# Altium schematic sheet HVD.SchDoc: PDM
size A3; CompanyName: eUSRacing; DrawnBy: Javier González; SheetNumber: 4; SheetTotal: 8
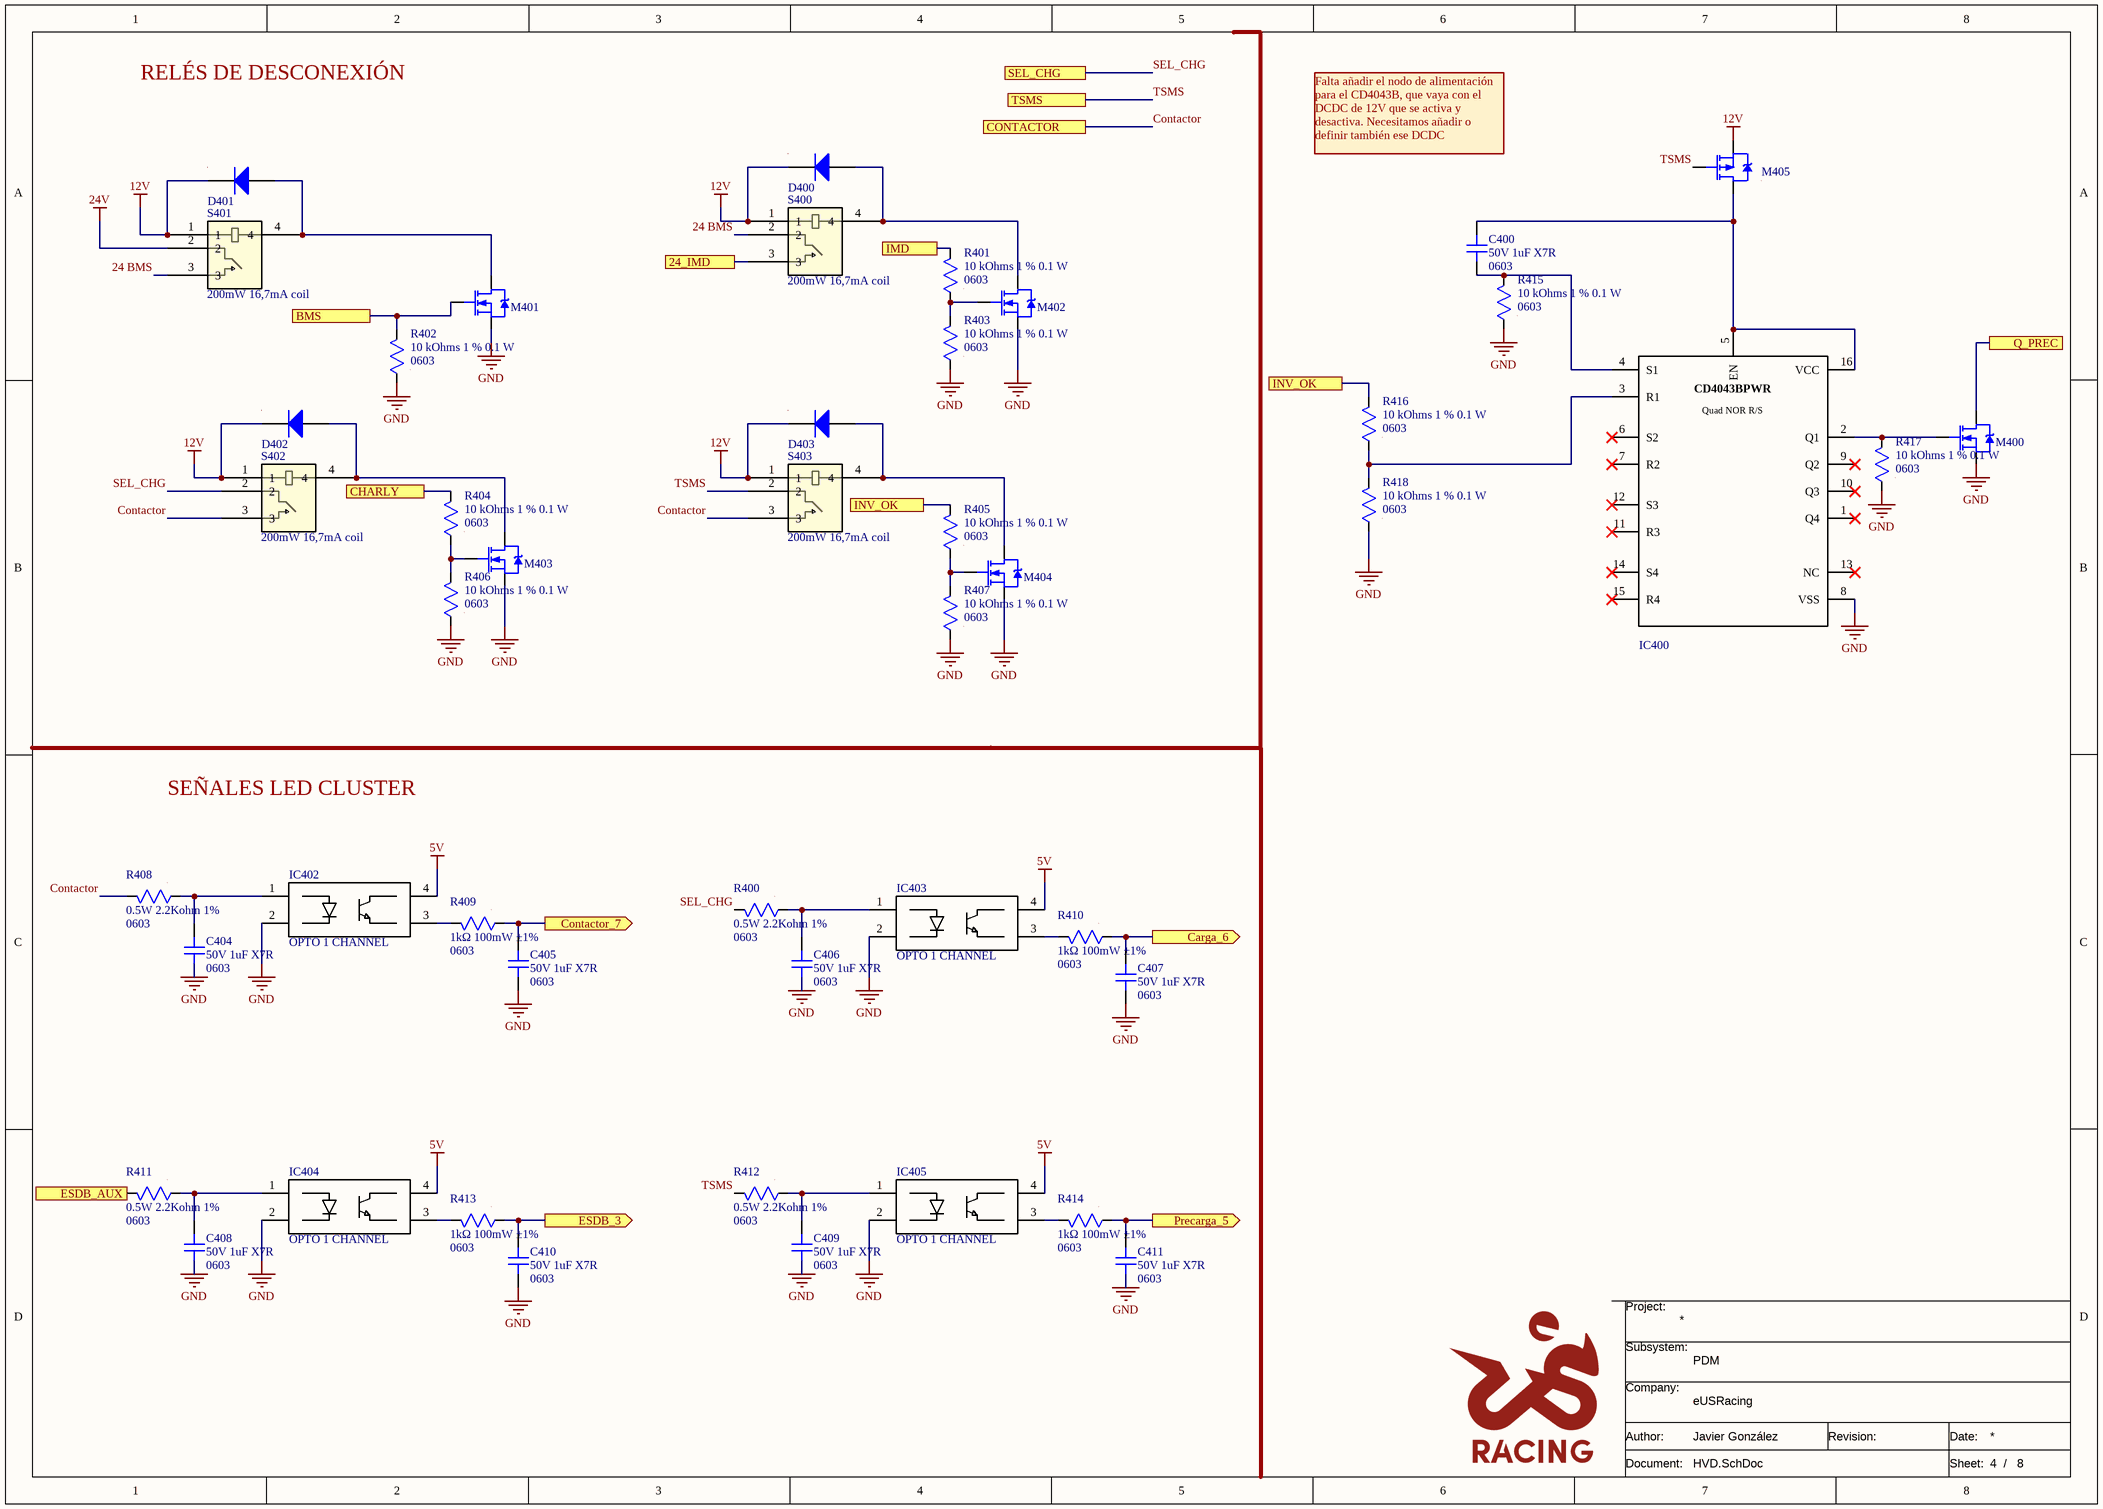
[diagram p0: HVD.SchDoc]

## Parts
C400  value 50V 1uF X7R  Package: 0603  [CAP SMD 0603]  (hidden comment: CAP non polarized)
C404  value 50V 1uF X7R  Package: 0603  [CAP SMD 0603]  (hidden comment: CAP non polarized)
C405  value 50V 1uF X7R  Package: 0603  [CAP SMD 0603]  (hidden comment: CAP non polarized)
C406  value 50V 1uF X7R  Package: 0603  [CAP SMD 0603]  (hidden comment: CAP non polarized)
C407  value 50V 1uF X7R  Package: 0603  [CAP SMD 0603]  (hidden comment: CAP non polarized)
C408  value 50V 1uF X7R  Package: 0603  [CAP SMD 0603]  (hidden comment: CAP non polarized)
C409  value 50V 1uF X7R  Package: 0603  [CAP SMD 0603]  (hidden comment: CAP non polarized)
C410  value 50V 1uF X7R  Package: 0603  [CAP SMD 0603]  (hidden comment: CAP non polarized)
C411  value 50V 1uF X7R  Package: 0603  [CAP SMD 0603]  (hidden comment: CAP non polarized)
D400  DIODE  [DO-214AC]  (value not drawn)
D401  DIODE  [DO-214AC]  (value not drawn)
D402  DIODE  [DO-214AC]  (value not drawn)
D403  DIODE  [DO-214AC]  (value not drawn)
IC400  CD4043BPWR  [TSOP16]  (value not drawn)
IC402  OPTO 1 CHANNEL  [DIP-4]
IC403  OPTO 1 CHANNEL  [DIP-4]
IC404  OPTO 1 CHANNEL  [DIP-4]
IC405  OPTO 1 CHANNEL  [DIP-4]
M400  MOSFET N  [SOT-323]  (value not drawn)
M401  MOSFET N  [SOT-323]  (value not drawn)
M402  MOSFET N  [SOT-323]  (value not drawn)
M403  MOSFET N  [SOT-323]  (value not drawn)
M404  MOSFET N  [SOT-323]  (value not drawn)
M405  MOSFET P  [SOT-23]  (value not drawn)
R400  value 0.5W 2.2Kohm 1%  Package: 0603  [RES SMD 0603]  (hidden comment: RES)
R401  value 10 kOhms 1 % 0.1 W  Package: 0603  [RES SMD 0603]  (hidden comment: RES)
R402  value 10 kOhms 1 % 0.1 W  Package: 0603  [RES SMD 0603]  (hidden comment: RES)
R403  value 10 kOhms 1 % 0.1 W  Package: 0603  [RES SMD 0603]  (hidden comment: RES)
R404  value 10 kOhms 1 % 0.1 W  Package: 0603  [RES SMD 0603]  (hidden comment: RES)
R405  value 10 kOhms 1 % 0.1 W  Package: 0603  [RES SMD 0603]  (hidden comment: RES)
R406  value 10 kOhms 1 % 0.1 W  Package: 0603  [RES SMD 0603]  (hidden comment: RES)
R407  value 10 kOhms 1 % 0.1 W  Package: 0603  [RES SMD 0603]  (hidden comment: RES)
R408  value 0.5W 2.2Kohm 1%  Package: 0603  [RES SMD 0603]  (hidden comment: RES)
R409  value 1kΩ 100mW ±1%  Package: 0603  [RES SMD 0603]  (hidden comment: RES)
R410  value 1kΩ 100mW ±1%  Package: 0603  [RES SMD 0603]  (hidden comment: RES)
R411  value 0.5W 2.2Kohm 1%  Package: 0603  [RES SMD 0603]  (hidden comment: RES)
R412  value 0.5W 2.2Kohm 1%  Package: 0603  [RES SMD 0603]  (hidden comment: RES)
R413  value 1kΩ 100mW ±1%  Package: 0603  [RES SMD 0603]  (hidden comment: RES)
R414  value 1kΩ 100mW ±1%  Package: 0603  [RES SMD 0603]  (hidden comment: RES)
R415  value 10 kOhms 1 % 0.1 W  Package: 0603  [RES SMD 0603]  (hidden comment: RES)
R416  value 10 kOhms 1 % 0.1 W  Package: 0603  [RES SMD 0603]  (hidden comment: RES)
R417  value 10 kOhms 1 % 0.1 W  Package: 0603  [RES SMD 0603]  (hidden comment: RES)
R418  value 10 kOhms 1 % 0.1 W  Package: 0603  [RES SMD 0603]  (hidden comment: RES)
S400  value 200mW 16,7mA coil  [G5NB-1A]  (hidden comment: RELE G5NB-1A)
S401  value 200mW 16,7mA coil  [G5NB-1A]  (hidden comment: RELE G5NB-1A)
S402  value 200mW 16,7mA coil  [G5NB-1A]  (hidden comment: RELE G5NB-1A)
S403  value 200mW 16,7mA coil  [G5NB-1A]  (hidden comment: RELE G5NB-1A)

## Ports
24_IMD, BMS, Carga_6 (out), CHARLY, CONTACTOR, Contactor_7 (out), ESDB_3 (out), ESDB_AUX, IMD, INV_OK, Precarga_5 (out), Q_PREC, SEL_CHG, TSMS

## Nets
5V: IC402.4(C_1) IC403.4(C_1) IC404.4(C_1) IC405.4(C_1)
12V: D400.K D401.K D402.K D403.K M405.2(S) S400.1 S401.1 S402.1 S403.1
24V: S401.2
GND: C404.2 C405.2 C406.2 C407.2 C408.2 C409.2 C410.2 C411.2 IC400.8(VSS) IC402.2(K_1) IC403.2(K_1) IC404.2(K_1) IC405.2(K_1) M400.2(S) M401.2(S) M402.2(S) M403.2(S) M404.2(S) R402.1 R403.1 R406.1 R407.1 R415.1 R417.1 R418.1
24 BMS: S400.2 S401.3
24_IMD: S400.3 ; port 24_IMD
BMS: M401.1(G) R402.2 ; port BMS
Carga_6: C407.1 R410.1 ; port Carga_6
CHARLY: R404.2 ; port CHARLY
Contactor: R408.2 S402.3 S403.3 ; port CONTACTOR
Contactor_7: C405.1 R409.1 ; port Contactor_7
ESDB_3: C410.1 R413.1 ; port ESDB_3
ESDB_AUX: R411.2 ; port ESDB_AUX
IMD: R401.2 ; port IMD
INV_OK: R405.2 R416.2 ; port INV_OK
Precarga_5: C411.1 R414.1 ; port Precarga_5
Q_PREC: M400.3(D) ; port Q_PREC
SEL_CHG: R400.2 S402.2 ; port SEL_CHG
TSMS: M405.1(G) R412.2 S403.2 ; port TSMS
NetC400_1: C400.1 IC400.4(S1) R415.2
NetC400_2: C400.2 IC400.5(EN) IC400.16(VCC) M405.3(D)
NetC404_1: C404.1 IC402.1(A_1) R408.1
NetC406_1: C406.1 IC403.1(A_1) R400.1
NetC408_1: C408.1 IC404.1(A_1) R411.1
NetC409_1: C409.1 IC405.1(A_1) R412.1
NetD400_A: D400.A M402.3(D) S400.4
NetD401_A: D401.A M401.3(D) S401.4
NetD402_A: D402.A M403.3(D) S402.4
NetD403_A: D403.A M404.3(D) S403.4
NetIC400_2: IC400.2(Q1) M400.1(G) R417.2
NetIC400_3: IC400.3(R1) R416.1 R418.2
NetIC402_3: IC402.3(E_1) R409.2
NetIC403_3: IC403.3(E_1) R410.2
NetIC404_3: IC404.3(E_1) R413.2
NetIC405_3: IC405.3(E_1) R414.2
NetM402_1: M402.1(G) R401.1 R403.2
NetM403_1: M403.1(G) R404.1 R406.2
NetM404_1: M404.1(G) R405.1 R407.2

Not connected (* = marked no-connect by the designer): IC400 1(Q4)* 6(S2)* 7(R2)* 9(Q2)* 10(Q3)* 11(R3)* 12(S3)* 13(NC)* 14(S4)* 15(R4)*

## Notes on the sheet
- RELÉS DE DESCONEXIÓN
- Falta añadir el nodo de alimentación para el CD4043B, que vaya con el DCDC de 12V que se activa y desactiva. Necesitamos añadir o definir también ese DCDC
- SEÑALES LED CLUSTER
- Project:
- Subsystem:
- Company:
- Document:
- Author:
- Revision:
- Date:
- Sheet:
- /
- (in symbol 051-0005) Quad NOR R/S

## Library data of the parts
C400 C404-C411 = 001-0102: Condensadores de cerámica multicapa (MLCC- SMD/SMT) WCAP-CSGP 1uF 50 Vol 10%; MPN: 885012206126; Manufacturer: Wurth Elektronik; ComponentLink1Description: Datasheet; ComponentLink1URL: https://www.we-online.com/components/products/datasheet/885012206126.pdf; ComponentLink2Description: Distributor Link; ComponentLink2URL: https://www.mouser.es/ProductDetail/Wurth-Elektronik/885012206126?qs=amGC7iS6iy%2F%252BJOLb%2FSuwig%3D%3D; ID: 001-0102; Distributor PN: 710-885012206126; Distributor: Mouser
D400-D403 = 030-0009: Rectificadores Diode, SMA, 1000V, 1A; MPN: M7; Manufacturer: Diotec Semiconductor; Value: 1000V 1A; ComponentLink1Description: Datasheet; ComponentLink1URL: https://diotec.com/request/datasheet/m1.pdf; ComponentLink2Description: Distributor Link; ComponentLink2URL: https://www.mouser.es/es/ProductDetail/Diotec-Semiconductor/M7?qs=sGAEpiMZZMtbRapU8LlZDx2r3HTumQni%2FMeyT6LdGtBy%252B1%2FubeLhmA%3D%3D; ID: 030-0009; Package: DO-214AC; Distributor PN: 637-M7; Distributor: Mouser
IC400 = 051-0005: Circuitos de cierre Tri-St. Quad NOR R/S; Manufacturer: TI; Value: S-R Latch; ComponentLink1Description: Datasheet; ComponentLink1URL: https://www.ti.com/lit/gpn/cd4043b; ComponentLink2Description: Distributor Link; ComponentLink2URL: https://www.mouser.es/es/ProductDetail/Texas-Instruments/CD4043BPWR?qs=sGAEpiMZZMutXGli8Ay4kD%252BkpvCmt1JbrHJ1tFIshEY%3D; ID: 051-0005; Package: TSSOP-16; MPN: CD4043BPWR; Distributor PN: 595-CD4043BPWR; Distributor: Mouser
IC402-IC405 = 041-0003: Optoacopladores para salidas de transistores WL-OCPT 35V 5KVrms 10pF Dip 4 S-Type; MPN: 140817142400; Manufacturer: Wurth Elektronik; ComponentLink1Description: Datasheet; ComponentLink1URL: https://www.we-online.com/catalog/datasheet/140817142400.pdf; ComponentLink2Description: Distributor Link; ComponentLink2URL: https://www.mouser.es/es/ProductDetail/Wurth-Elektronik/140817142400?qs=81r%252BiQLm7BQPLeRqqgk3BQ%3D%3D; ID: 041-0003; Value: -; Package: DIP-4; Distributor PN: 710-140817142400; Distributor: Mouser
M400-M404 = 043-0003: MOSFET MOSFET, SOT-323, 60V, 0.115A, 150C, N; MPN: 2N7002W; Manufacturer: Diotec Semiconductor; ComponentLink1Description: Datasheet; ComponentLink1URL: https://diotec.com/request/datasheet/2n7002w.pdf; ComponentLink2Description: Distributor Link; ComponentLink2URL: https://www.mouser.es/es/ProductDetail/Diotec-Semiconductor/2N7002W?qs=Wj%2FVkw3K%252BMDU9BLZDRTLeQ%3D%3D; ID: 043-0003; Value: N; Package: SOT-323; Distributor PN: 637-2N7002W; Distributor: Mouser
M405 = 043-0006: MOSFET 30V P-Ch Enh Mode 50mOhm -10Vgs -4.3A; MPN: DMP3056L-7; Manufacturer: Diodes Incorporated; ComponentLink1Description: Datasheet; ComponentLink1URL: https://4donline.ihs.com/images/VipMasterIC/IC/DIOD/DIOD-S-A0012884531/DIOD-S-A0012915142-1.pdf?hkey=CECEF36DEECDED6468708AAF2E19C0C6; ComponentLink2Description: Distributor Link; ComponentLink2URL: https://www.mouser.es/es/ProductDetail/Diodes-Incorporated/DMP3056L-7?qs=OVC8WVYZliQTX9kMWW%252B96Q%3D%3D; ID: 043-0006; Value: P; Package: SOT-23-3; Distributor PN: 621-DMP3056L-7; Distributor: Mouser
R400 R408 R411 R412 = 010-0193: Resistores de película gruesa - SMD 0.5W 2.2Kohm 1% AEC-Q200; MPN: SG73P1JTTD2201F; Manufacturer: KOA Speer; ComponentLink1Description: Datasheet; ComponentLink1URL: https://www.koaspeer.com/pdfs/SG73P.pdf; ComponentLink2Description: Distributor Link; ComponentLink2URL: https://www.mouser.es/es/ProductDetail/KOA-Speer/SG73P1JTTD2201F?qs=sGAEpiMZZMtlubZbdhIBIMav4eZf%2FxzgRyo3bnq6lCo%3D; ID: 010-0193; Distributor PN: 660-SG73P1JTTD2201F; Distributor: Mouser
R401-R407 R415-R418 = 010-0194: Resistores de película gruesa - SMD WRIS-RSKS 10 kOhms 1 % 0.1 W 0603 AEC-Q200; MPN: 560112116005; Manufacturer: Wurth Elektronik; ComponentLink1Description: Datasheet; ComponentLink1URL: https://www.we-online.com/catalog/datasheet/560112116005.pdf; ComponentLink2Description: Distributor Link; ComponentLink2URL: https://www.mouser.es/es/ProductDetail/Wurth-Elektronik/560112116005?qs=mELouGlnn3dMVSPHwBGouA%3D%3D; ID: 010-0194; Distributor PN: 710-560112116005; Distributor: Mouser
R409 R410 R413 R414 = 010-0170: Thick Film Resistors WRIS-RSKS 1 kOhms 1 % 0.1 W 0603 AEC-Q200; MPN: 560112116014; Manufacturer: Wurth Elektronik; ComponentLink1Description: Datasheet; ComponentLink1URL: https://www.we-online.com/components/products/datasheet/560112116014.pdf; ComponentLink2Description: Distributor Link; ComponentLink2URL: https://www.mouser.es/ProductDetail/Wurth-Elektronik/560112116014?qs=sGAEpiMZZMvdGkrng054txLI%2FDB4oIKD92viHLDiYpSVemZawWv4yQ%3D%3D; ID: 010-0170; Distributor PN: 710-560112116014; Distributor: Mouser
S400-S403 = 100-0025: Relés universales SPST-NO Flux-Tight 12VDC High-Capacity; MPN: G5NB-1A-E-DC12; Manufacturer: Aratas; ComponentLink1Description: Datasheet; ComponentLink1URL: https://www.mouser.es/datasheet/3/39/1/J143-E1.pdf; ComponentLink2Description: Distributor Link; ComponentLink2URL: https://www.mouser.es/es/ProductDetail/Aratas/G5NB-1A-E-DC12?qs=3jhwTwe4bOEMzTXvngirDw%3D%3D; ID: 100-0025; Package: 20,5x7,2x15,3mm; Distributor PN: 653-G5NB-1A-E-DC12; Distributor: Mouser